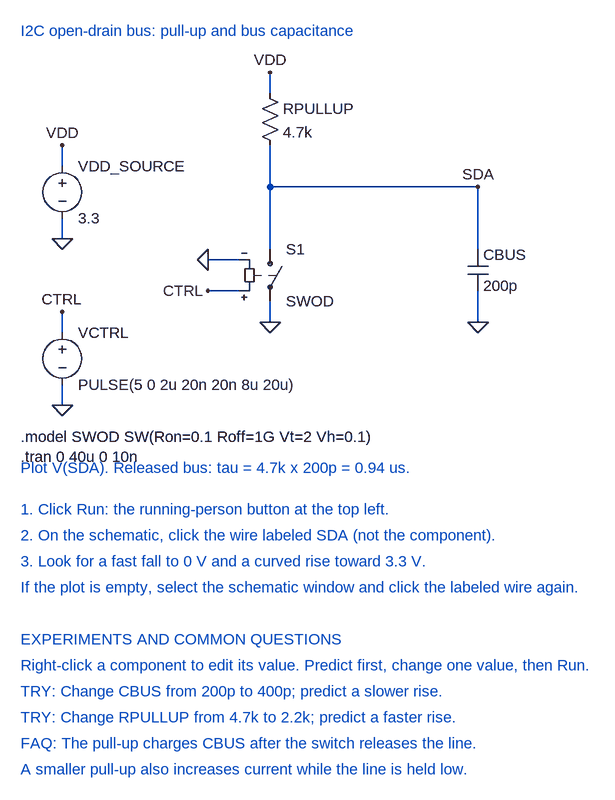
[diagram p0: schematic 07-i2c-open-drain-rise-time.asc]
07-i2c-open-drain-rise-time.asc, the LTspice schematic file:
Version 4
SHEET 1 1200 1400
WIRE 128 208 128 240
WIRE 128 320 128 352
WIRE 448 96 448 128
WIRE 448 208 448 272
WIRE 448 272 768 272
WIRE 768 272 768 368
WIRE 768 432 768 480
WIRE 448 272 448 368
WIRE 448 448 448 480
WIRE 400 384 352 384
WIRE 400 432 352 432
WIRE 128 464 128 496
WIRE 128 576 128 608
FLAG 128 208 VDD
FLAG 128 352 0
FLAG 448 96 VDD
FLAG 768 272 SDA
FLAG 768 480 0
FLAG 448 480 0
FLAG 352 384 0
FLAG 352 432 CTRL
FLAG 128 464 CTRL
FLAG 128 608 0
SYMBOL voltage 128 224 R0
SYMATTR InstName VDD_SOURCE
SYMATTR Value 3.3
SYMBOL res 432 112 R0
SYMATTR InstName RPULLUP
SYMATTR Value 4.7k
SYMBOL cap 752 368 R0
SYMATTR InstName CBUS
SYMATTR Value 200p
SYMBOL sw 448 352 R0
SYMATTR InstName S1
SYMATTR Value SWOD
SYMBOL voltage 128 480 R0
SYMATTR InstName VCTRL
SYMATTR Value PULSE(5 0 2u 20n 20n 8u 20u)
TEXT 64 32 Left 2 ;I2C open-drain bus: pull-up and bus capacitance
TEXT 64 656 Left 2 !.model SWOD SW(Ron=0.1 Roff=1G Vt=2 Vh=0.1)\n.tran 0 40u 0 10n
TEXT 64 704 Left 2 ;Plot V(SDA). Released bus: tau = 4.7k x 200p = 0.94 us.
TEXT 64 768 Left 2 ;1. Click Run: the running-person button at the top left.
TEXT 64 808 Left 2 ;2. On the schematic, click the wire labeled SDA (not the component).
TEXT 64 848 Left 2 ;3. Look for a fast fall to 0 V and a curved rise toward 3.3 V.
TEXT 64 888 Left 2 ;If the plot is empty, select the schematic window and click the labeled wire again.
TEXT 64 968 Left 2 ;EXPERIMENTS AND COMMON QUESTIONS
TEXT 64 1008 Left 2 ;Right-click a component to edit its value. Predict first, change one value, then Run.
TEXT 64 1048 Left 2 ;TRY: Change CBUS from 200p to 400p; predict a slower rise.
TEXT 64 1088 Left 2 ;TRY: Change RPULLUP from 4.7k to 2.2k; predict a faster rise.
TEXT 64 1128 Left 2 ;FAQ: The pull-up charges CBUS after the switch releases the line.
TEXT 64 1168 Left 2 ;A smaller pull-up also increases current while the line is held low.

The netlist it stands for:
* 07-i2c-open-drain-rise-time.asc
VDD_SOURCE VDD 0 3.3
RPULLUP VDD SDA 4.7k
CBUS SDA 0 200p
S1 SDA 0 CTRL 0 SWOD
VCTRL CTRL 0 PULSE(5 0 2u 20n 20n 8u 20u)
* I2C open-drain bus: pull-up and bus capacitance
.model SWOD SW(Ron=0.1 Roff=1G Vt=2 Vh=0.1)
.tran 0 40u 0 10n
* Plot V(SDA). Released bus: tau = 4.7k x 200p = 0.94 us.
* 1. Click Run: the running-person button at the top left.
* 2. On the schematic, click the wire labeled SDA (not the component).
* 3. Look for a fast fall to 0 V and a curved rise toward 3.3 V.
* If the plot is empty, select the schematic window and click the labeled wire again.
* EXPERIMENTS AND COMMON QUESTIONS
* Right-click a component to edit its value. Predict first, change one value, then Run.
* TRY: Change CBUS from 200p to 400p; predict a slower rise.
* TRY: Change RPULLUP from 4.7k to 2.2k; predict a faster rise.
* FAQ: The pull-up charges CBUS after the switch releases the line.
* A smaller pull-up also increases current while the line is held low.
.backanno
.end